# Altium project Sound_Sensor.PrjPcb (part 2 of 4)

## Sheet Connector_Sheet.SchDoc
size A4; DocumentNumber: 9; SheetNumber: 9; SheetTotal: 11
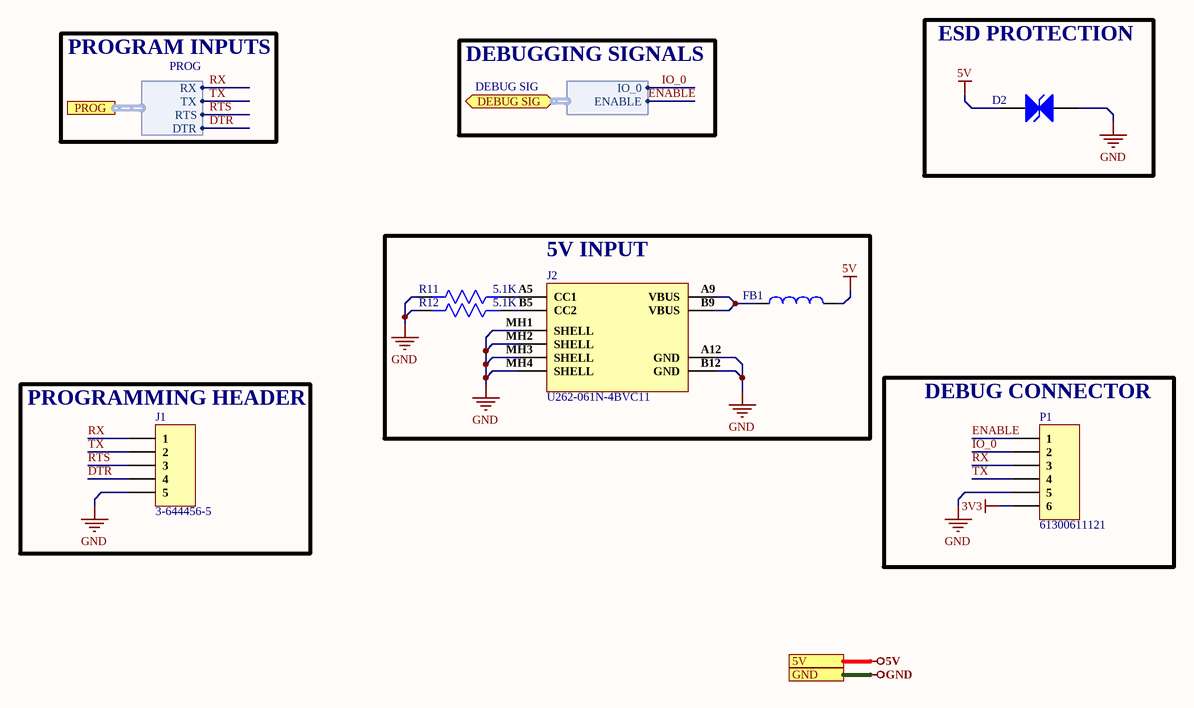
[diagram p4: Connector_Sheet.SchDoc]

### Parts
D2  TPD1E10B06DPYR  [X1SON - 0.45 mm max height]  (value not drawn)
FB1  BLM18SG121TN1D  [IND-0603 (1608 Metric)]  (value not drawn)
J1  3-644456-5  [HDR1X5]
J2  U262-061N-4BVC11  [U262-061N-4BVC11]
P1  61300611121  [HDR1X6]
R11  5.1K  [Res0603]
R12  5.1K  [Res0603]

### Blocks framed on the sheet
ESD PROTECTION: D2
5V INPUT: FB1 J2 R11 R12
PROGRAMMING HEADER: J1
DEBUG CONNECTOR: P1

### Ports
5V, DEBUG SIG (bidir, harness DEBUG SIG), GND, PROG (harness PROG)

### Harnesses
PROG: RX, TX, RTS, DTR
DEBUG SIG: IO_0, ENABLE

### Nets
3V3: P1.6
5V: D2.2 FB1.2 ; port 5V
GND: D2.1 J1.5 J2.A12(GND) J2.B12(GND) J2.MH1(SHELL) J2.MH2(SHELL) J2.MH3(SHELL) J2.MH4(SHELL) P1.5 R11.2 R12.2 ; port GND
DTR: J1.4 ; port PROG.DTR
ENABLE: P1.1 ; port DEBUG SIG.ENABLE  [project net DEBUG SIG.ENABLE]
IO_0: P1.2 ; port DEBUG SIG.IO_0  [project net DEBUG SIG.IO_0]
RTS: J1.3 ; port PROG.RTS
RX: J1.1 P1.3 ; port PROG.RX
TX: J1.2 P1.4 ; port PROG.TX
NetFB1_1: FB1.1 J2.A9(VBUS) J2.B9(VBUS)
NetJ2_A5: J2.A5(CC1) R11.1
NetJ2_B5: J2.B5(CC2) R12.1

### Notes on the sheet
- PROGRAM INPUTS
- DEBUGGING SIGNALS
- File:
- Title:
- Date:
- Page
- Num:
- Total:
- Drawn By: Huzaifa Ali

### Library data of the parts
D2 = TPD1E10B06DPYR: DIODE TVS SMD 5.5V 5A 90W; Manufacturer: Texas Instruments; Capacitance: 12pF; Direction: Bidirectional; Breakdown Voltage: 6V; Number of Channels: 1; Clamping Voltage: 14V; Power Line Protection: No; Leakage Current: 100nA; ESD Protection: Yes; Test Current: 1mA; Element Configuration: Single; Interface: GPIO; Diode Type: ZENER; Supplier 1: Mouser; Manufacturer Part Number: TPD1E10B06DPYR; RoHS: Yes; Category: TVS Diodes; Pricing 1: 1=0.39000, 10=0.29800, 50=0.29800, 100=0.18600, 500=0.12700, 1000=0.09800, 2500=0.08300, 10000=0.07500 (USD); Case/Package: SON; Number of Pins: 2; Contact Plating: Gold; Min Operating Temperature: -40°C; Max Operating Temperature: 125°C; Package Quantity: 1; Packaging: Tape and Reel; Number of Bidirectional Channels: 1; Reverse Standoff Voltage: 5.5V; Min Breakdown Voltage: 6V; Peak Pulse Power: 90W; Working Voltage: 5.5V; Max Reverse Leakage Current: 100nA; Peak Pulse Current: 5A; Resistor Type: Zener; Series: -; Length: 1.1mm; Width: 0.7mm; Height: 0.35mm; Radiation Hardening: No; REACH SVHC: No SVHC; Lead Free: Lead Free; RoHS Compliant: Yes; ComponentLink1URL: https://datasheet.ciiva.com/22691/1877100-22691786.pdf?src-supplier=Element14; ComponentLink1Description: https://datasheet.ciiva.com/22691/1877100-22691786.pdf?src-supplier=Element14; ComponentLink2URL: https://datasheet.ciiva.com/46384/1877100-46384054.pdf?src-supplier=Element14; ComponentLink2Description: https://datasheet.ciiva.com/46384/1877100-46384054.pdf?src-supplier=Element14; ComponentLink3URL: https://datasheet.ciiva.com/2961/tpd1e10b06-2961245.pdf?src-supplier=Digi-Key; ComponentLink3Description: https://datasheet.ciiva.com/2961/tpd1e10b06-2961245.pdf?src-supplier=Digi-Key; ComponentLink4URL: https://datasheet.ciiva.com/6574/tpd1e10b06-6574654.pdf?src-supplier=Digi-Key; ComponentLink4Description: https://datasheet.ciiva.com/6574/tpd1e10b06-6574654.pdf?src-supplier=Digi-Key; ComponentLink5URL: https://datasheet.ciiva.com/2961/tpd1e10b06-2961246.pdf?src-supplier=Digi-Key; ComponentLink5Description: https://datasheet.ciiva.com/2961/tpd1e10b06-2961246.pdf?src-supplier=Digi-Key; ComponentLink6URL: https://datasheet.ciiva.com/14195/tpd1e10b06-14195178.pdf?src-supplier=Avnet; ComponentLink6Description: https://datasheet.ciiva.com/14195/tpd1e10b06-14195178.pdf?src-supplier=Avnet; Supplier Part Number 1: 595-TPD1E10B06DPYR
FB1 = BLM18SG121TN1D: FERRITE BEAD 120 OHM 0603 1LN; Manufacturer: Murata; Material: Steel,Ferrite; Tolerance: 25%; Impedance: 120R; DC Resistance (DCR): 25mR; Max DC Current: 3A; Number of Lines: 1; Test Frequency: 100MHz; Shielding: Unshielded; Supplier 1: Arrow Electronics; Manufacturer Part Number: BLM18SG121TN1D; RoHS: Yes; Category: Ferrite Beads and Chips; Stock 1: 82612; Pricing 1: 1=0.12640, 10=0.08350, 25=0.07210, 100=0.05150, 250=0.04730, 500=0.04110, 1000=0.03420, 3000=0.03360, 6000=0.03320, 15000=0.03270, 30000=0.03200, 75000=0.03150 (USD); Case/Package: 0603; Number of Pins: 2; Core Material: Ferrite; Case Code (Metric): 1608; Case Code (Imperial): 0603; Min Operating Temperature: -55°C; Max Operating Temperature: 125°C; Package Quantity: 1; Max Current Rating: 3A; Packaging: Tape and Reel; Current Rating: 3A; Termination: SMD/SMT; Frequency: 100MHz; Number of Circuits: 1; Series: BLM18S; DC Resistance-Max: 25mR; Length: 1.6mm; Width: 0.8mm; Height: 0.8mm; Depth: 0.8mm; Reach SVHC Compliant: Yes; Lead Free: Lead Free; RoHS Compliant: Yes; ComponentLink1URL: https://datasheet.ciiva.com/1012/l0110s0100blm18s-1012624.pdf?src-supplier=Digi-Key; ComponentLink1Description: https://datasheet.ciiva.com/1012/l0110s0100blm18s-1012624.pdf?src-supplier=Digi-Key; ComponentLink2URL: https://datasheet.ciiva.com/11799/0900766b811b5866-11799181.pdf?src-supplier=RSComponents; ComponentLink2Description: https://datasheet.ciiva.com/11799/0900766b811b5866-11799181.pdf?src-supplier=RSComponents; ComponentLink3URL: https://datasheet.ciiva.com/18093/getdatasheetpartid-295885-18093249.pdf?src-supplier=Verical; ComponentLink3Description: https://datasheet.ciiva.com/18093/getdatasheetpartid-295885-18093249.pdf?src-supplier=Verical; ComponentLink4URL: https://datasheet.ciiva.com/41449/001171723-da-01-en-chip-drossel0603-120r-3000ma-1-6x0-8mm-41449353.pdf?src-supplier=Conrad; ComponentLink4Description: https://datasheet.ciiva.com/41449/001171723-da-01-en-chip-drossel0603-120r-3000ma-1-6x0-8mm-41449353.pdf?src-supplier=Conrad; ComponentLink5URL: https://datasheet.ciiva.com/41449/001172312-da-01-en-drossel-0603-120r-1-6x0-8mm-10000st-41449675.pdf?src-supplier=Conrad; ComponentLink5Description: https://datasheet.ciiva.com/41449/001172312-da-01-en-drossel-0603-120r-1-6x0-8mm-10000st-41449675.pdf?src-supplier=Conrad; ComponentLink6URL: https://datasheet.ciiva.com/8021/5151-8021511.pdf?src-supplier=Element14; ComponentLink6Description: https://datasheet.ciiva.com/8021/5151-8021511.pdf?src-supplier=Element14; ComponentLink7URL: https://datasheet.ciiva.com/8021/5151-8021512.pdf?src-supplier=Element14; ComponentLink7Description: https://datasheet.ciiva.com/8021/5151-8021512.pdf?src-supplier=Element14; ComponentLink8URL: https://datasheet.ciiva.com/14122/blm-series-eng-tds-14122906.pdf?src-supplier=Distrelec; ComponentLink8Description: https://datasheet.ciiva.com/14122/blm-series-eng-tds-14122906.pdf?src-supplier=Distrelec; ComponentLink9URL: https://datasheet.ciiva.com/1012/l0110s0100blm18s-1012623.pdf?src-supplier=Digi-Key; ComponentLink9Description: https://datasheet.ciiva.com/1012/l0110s0100blm18s-1012623.pdf?src-supplier=Digi-Key; ComponentLink10URL: https://datasheet.ciiva.com/1012/l0110s0100blm18s-1012625.pdf?src-supplier=Digi-Key; ComponentLink10Description: https://datasheet.ciiva.com/1012/l0110s0100blm18s-1012625.pdf?src-supplier=Digi-Key; ComponentLink11URL: https://datasheet.ciiva.com/16395/l0110s0100blm18s-16395498.pdf?src-supplier=Future+Electronics; ComponentLink11Description: https://datasheet.ciiva.com/16395/l0110s0100blm18s-16395498.pdf?src-supplier=Future+Electronics; Supplier Part Number 1: BLM18SG121TN1D; LCSC Part Number: C113030; Item Type: Ferrite Bead
J1 = 3-644456-5: 05P MTA100 HDR ASSY (NARROW); Manufacturer: TE Connectivity; Underplate Material: Nickel; Number of Positions: 5; Connector Type: Plug,Header,Pin; Mating Alignment: No (Without); PCB Mount Retention: Without; Max Voltage Rating (AC): 250V; Connector System: Wire-to-Board; Contact Current Rating: 5A; Contact Resistance: 6mR; Gender: Male; PCB Mounting Orientation: Vertical; Contact Style: Straight; Pitch: 2.54mm; Plating Thickness: 1.27um; PCB Thickness: 0.063inch; Tail Length: 0.11inch; Approvals: CSA; Supplier 1: Digi-Key; Manufacturer Part Number: 3-644456-5; RoHS: Yes; Category: Connectors; Stock 1: 30835; Pricing 1: 1=0.45000, 10=0.39200, 100=0.32330, 500=0.28114, 1000=0.23195, 5000=0.20383, 10000=0.18978 (USD); Mount: Through Hole; Color: Natural; Housing Material: Polyester; Housing Color: Natural; Contact Plating: Tin,Matte; Contact Material: Copper Alloy; Contact Shape: Square; Insulation Material: Thermoplastic; Insulation Color: Natural; Contact Finish - Mating: TIN; Min Operating Temperature: -67°C; Max Operating Temperature: 221°C; Number of Rows: 1; Packaging: Bag; Package Quantity: 500; Contact Gender: Male; Termination: Solder; Orientation: Straight; Number of Contacts: 5; Strain Relief: No (Without); Contact Retention: No (Without); Mating Retention: No (Without); PCB Mount Alignment: No (Without); Sealable: No (Without); Shrouded: No (Without); Voltage Rating: 250V; Voltage Rating (AC): 250V; Current Rating: 5A; Backwall/Post Interruptions: No (Without); Series: MTA-100; Contact Type: Male Pin; Length: 12.4mm; Height: 10.03mm; Contact Mating Length: 7.49mm; Depth: 2.33mm; Radiation Hardening: No; Flammability Rating: UL94 V-0; ELV: Compliant; Lead Free: Lead Free; REACH SVHC: Unknown; ComponentLink1URL: https://datasheet.ciiva.com/16307/3-644456-5-16307486.pdf?src-supplier=Future+Electronics; ComponentLink1Description: https://datasheet.ciiva.com/16307/3-644456-5-16307486.pdf?src-supplier=Future+Electronics; ComponentLink2URL: https://datasheet.ciiva.com/3118/eng-ds-82056-mta-0608-3118213.pdf?src-supplier=Avnet; ComponentLink2Description: https://datasheet.ciiva.com/3118/eng-ds-82056-mta-0608-3118213.pdf?src-supplier=Avnet; ComponentLink3URL: https://datasheet.ciiva.com/30250/8852eng-ds-82056-mta-0608-30250984.pdf?src-supplier=Onlinecomponents.com; ComponentLink3Description: https://datasheet.ciiva.com/30250/8852eng-ds-82056-mta-0608-30250984.pdf?src-supplier=Onlinecomponents.com; ComponentLink4URL: https://datasheet.ciiva.com/14641/70087179-14641766.pdf?src-supplier=Allied+Electronics; ComponentLink4Description: https://datasheet.ciiva.com/14641/70087179-14641766.pdf?src-supplier=Allied+Electronics; ComponentLink5URL: https://datasheet.ciiva.com/709/eng-cd-644456-d2-709724.pdf?src-supplier=Digi-Key; ComponentLink5Description: https://datasheet.ciiva.com/709/eng-cd-644456-d2-709724.pdf?src-supplier=Digi-Key; Supplier Part Number 1: A31115-ND
J2 = U262-061N-4BVC11: USB 3.1 1 Surface Mount 6 Female -25℃~+85℃ Type-C SMD USB Connectors ROHS; Manufacturer: XKB; Manufacturer Part Number: U262-061N-4BVC11; Footprint: Custom; ComponentLink1Description: LCSC; ComponentLink1URL: https://www.lcsc.com/product-detail/span-style-background-color-ff0-USB-span-Connectors_XKB-Connectivity-U262-061N-4BVC11_C2764612.html; LCSC Part Number: C2764612; Item Type: USB Connector
P1 = e-50004: CONN HEADER VERT 6POS 2.54MM; Manufacturer: Wurth Electronics; Current Rating: 3A; Voltage Rating: 250V; Number of Positions: 6; Gender: Male; Connector Type: Male Pin; Pitch: 0.1inch; Supplier 1: Digi-Key; Manufacturer Part Number: 61300611121; Stock 1: 14573; Pricing 1: 1=0.33, 10=0.279, 25=0.232, 50=0.194, 100=0.176, 1000=0.16 (USD); Mount: Through Hole; Contact Plating: Gold; Contact Material: Copper Alloy,Copper; Housing Material: PBT; Color: Black; Min Operating Temperature: -40°C; Max Operating Temperature: 125°C; Number of Rows: 1; Contact Gender: Male; Packaging: Bulk; Termination: Through Hole; Number of Contacts: 6; Contact Mating Length: 0.236inch; REACH SVHC: Unknown; Lead Free: Lead Free; ComponentLink1URL: http://www.farnell.com/cad/1737268.pdf?src-supplier=Element14; ComponentLink1Description: http://www.farnell.com/cad/1737268.pdf?src-supplier=Element14; ComponentLink2URL: https://katalog.we-online.de/em/datasheet/6130xx11121.pdf?src-supplier=Digi-Key; ComponentLink2Description: https://katalog.we-online.de/em/datasheet/6130xx11121.pdf?src-supplier=Digi-Key; ComponentLink3URL: http://www.mouser.com/ds/2/445/6130xx11121-538006.pdf?src-supplier=Mouser; ComponentLink3Description: http://www.mouser.com/ds/2/445/6130xx11121-538006.pdf?src-supplier=Mouser; Supplier Part Number 1: 732-5319-ND
R11 R12 = RC0603JR-075K1L: RES SMD 5.1K OHM 5% 1/10W 0603; Manufacturer: Yageo; Resistance: 5.1kR; Power Rating: 100mW; Voltage Rating: 50V; Temperature Coefficient: 100ppm/°C; Supplier 1: Digi-Key; Manufacturer Part Number: RC0603JR-075K1L; RoHS: Yes; Category: Chip SMD Resistors; Stock 1: 245818; Pricing 1: 1=0.10000, 10=0.02000, 100=0.00800, 1000=0.00360, 2500=0.00312 (USD); Case/Package: 0603; Number of Pins: 2; Case Code (Imperial): 0603; Case Code (Metric): 1608; Size Code: 0603; Min Operating Temperature: -55°C; Max Operating Temperature: 155°C; Tolerance: 5%; Packaging: Tape and Reel; Termination: SMD/SMT; Resistor Type: Thick Film; Voltage Rating (DC): 50V; Features: Moisture Resistant; Series: RC; Max Power Dissipation: 100mW; Number of Terminations: 2; Resistance Tolerance: 5%; Construction: Rectangular; Length: 1.6mm; Depth: 0.8mm; REACH SVHC: No SVHC; Military Standard: Not; Lead Free: Lead Free; RoHS Compliant: Yes; ComponentLink1URL: http://www.mouser.com/ds/2/447/RC0603-272842.pdf?src-supplier=Mouser; ComponentLink1Description: http://www.mouser.com/ds/2/447/RC0603-272842.pdf?src-supplier=Mouser; ComponentLink2URL: http://components.arrow.com/part/dataview/0323_00047491?src-supplier=Arrow+Europe; ComponentLink2Description: http://components.arrow.com/part/dataview/0323_00047491?src-supplier=Arrow+Europe; ComponentLink3URL: http://www.farnell.com/datasheets/2167052.pdf?src-supplier=Farnell; ComponentLink3Description: http://www.farnell.com/datasheets/2167052.pdf?src-supplier=Farnell; ComponentLink4URL: http://www.farnell.com/datasheets/2167052.pdf?src-supplier=Element14; ComponentLink4Description: http://www.farnell.com/datasheets/2167052.pdf?src-supplier=Element14; ComponentLink5URL: http://www.farnell.com/datasheets/2167052.pdf?src-supplier=Newark; ComponentLink5Description: http://www.farnell.com/datasheets/2167052.pdf?src-supplier=Newark; ComponentLink6URL: http://www.farnell.com/datasheets/1868787.pdf?src-supplier=Newark; ComponentLink6Description: http://www.farnell.com/datasheets/1868787.pdf?src-supplier=Newark; ComponentLink7URL: http://www.yageo.com/documents/recent/PYu-RC_Group_51_RoHS_L_10.pdf?src-supplier=Digi-Key; ComponentLink7Description: http://www.yageo.com/documents/recent/PYu-RC_Group_51_RoHS_L_10.pdf?src-supplier=Digi-Key; ComponentLink8URL: http://www.yageo.com/documents/recent/PYu-RC0603_51_RoHS_L_7.pdf?src-supplier=Future+Electronics; ComponentLink8Description: http://www.yageo.com/documents/recent/PYu-RC0603_51_RoHS_L_7.pdf?src-supplier=Future+Electronics; Supplier Part Number 1: 311-5.1KGRCT-ND

## Sheet ADC_2_Section.SchDoc
size A4; DocumentNumber: 7; SheetNumber: 7; SheetTotal: 11
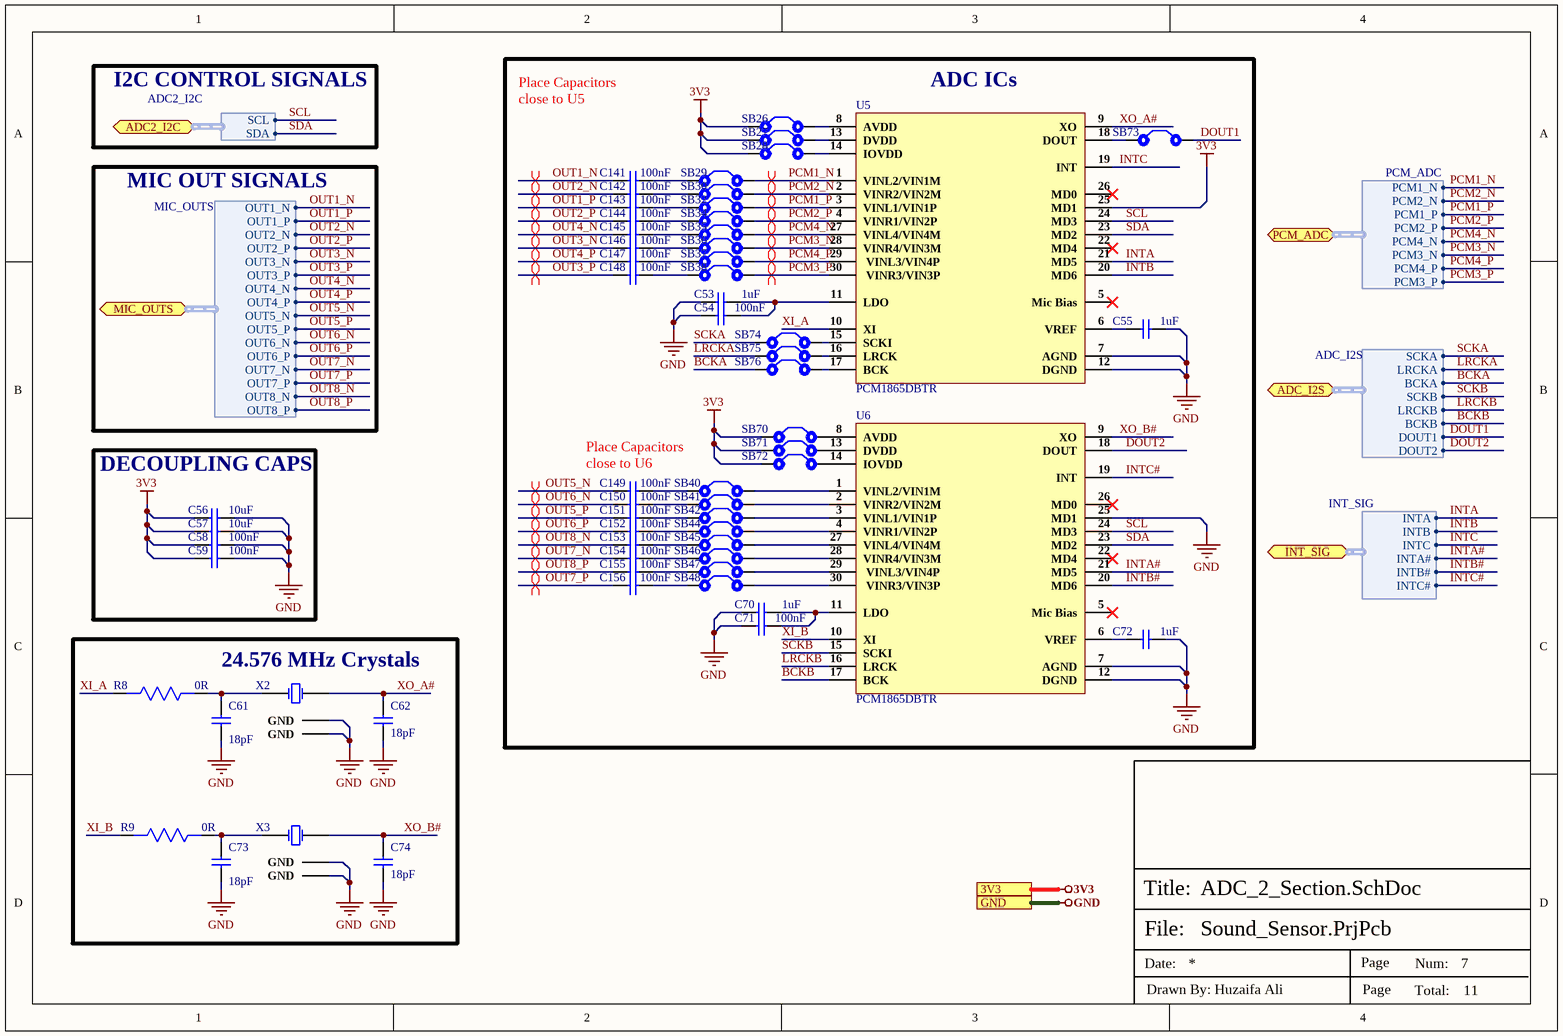
[diagram p5: ADC_2_Section.SchDoc]

### Parts
C53  1uF  [Cap-0402]
C54  100nF  [Cap-0603]
C55  1uF  [Cap-0402]
C56  10uF  [Cap-0603]
C57  10uF  [Cap-0603]
C58  100nF  [Cap-0603]
C59  100nF  [Cap-0603]
C61  18pF  [Cap 0603]
C62  18pF  [Cap 0603]
C70  1uF  [Cap-0402]
C71  100nF  [Cap-0603]
C72  1uF  [Cap-0402]
C73  18pF  [Cap 0603]
C74  18pF  [Cap 0603]
C141  100nF  [Cap-0402]
C142  100nF  [Cap-0402]
C143  100nF  [Cap-0402]
C144  100nF  [Cap-0402]
C145  100nF  [Cap-0402]
C146  100nF  [Cap-0402]
C147  100nF  [Cap-0402]
C148  100nF  [Cap-0402]
C149  100nF  [Cap-0402]
C150  100nF  [Cap-0402]
C151  100nF  [Cap-0402]
C152  100nF  [Cap-0402]
C153  100nF  [Cap-0402]
C154  100nF  [Cap-0402]
C155  100nF  [Cap-0402]
C156  100nF  [Cap-0402]
R8  0R  [Res0603]
R9  0R  [Res0603]
SB26  Solder Bridge  [Solder Bridge]  (value not drawn)
SB27  Solder Bridge  [Solder Bridge]  (value not drawn)
SB28  Solder Bridge  [Solder Bridge]  (value not drawn)
SB29  Solder Bridge  [Solder Bridge]  (value not drawn)
SB30  Solder Bridge  [Solder Bridge]  (value not drawn)
SB32  Solder Bridge  [Solder Bridge]  (value not drawn)
SB34  Solder Bridge  [Solder Bridge]  (value not drawn)
SB35  Solder Bridge  [Solder Bridge]  (value not drawn)
SB36  Solder Bridge  [Solder Bridge]  (value not drawn)
SB37  Solder Bridge  [Solder Bridge]  (value not drawn)
SB38  Solder Bridge  [Solder Bridge]  (value not drawn)
SB40  Solder Bridge  [Solder Bridge]  (value not drawn)
SB41  Solder Bridge  [Solder Bridge]  (value not drawn)
SB42  Solder Bridge  [Solder Bridge]  (value not drawn)
SB44  Solder Bridge  [Solder Bridge]  (value not drawn)
SB45  Solder Bridge  [Solder Bridge]  (value not drawn)
SB46  Solder Bridge  [Solder Bridge]  (value not drawn)
SB47  Solder Bridge  [Solder Bridge]  (value not drawn)
SB48  Solder Bridge  [Solder Bridge]  (value not drawn)
SB70  Solder Bridge  [Solder Bridge]  (value not drawn)
SB71  Solder Bridge  [Solder Bridge]  (value not drawn)
SB72  Solder Bridge  [Solder Bridge]  (value not drawn)
SB73  Solder Bridge  [Solder Bridge]  (value not drawn)
SB74  Solder Bridge  [Solder Bridge]  (value not drawn)
SB75  Solder Bridge  [Solder Bridge]  (value not drawn)
SB76  Solder Bridge  [Solder Bridge]  (value not drawn)
U5  PCM1865DBTR  [PCM1865DBTR]
U6  PCM1865DBTR  [PCM1865DBTR]
X2  S3224576121060  [S3224576121060]  (value not drawn)
X3  S3224576121060  [S3224576121060]  (value not drawn)

### Blocks framed on the sheet
ADC ICs: C53-C55 C70-C72 C141-C156 SB26-SB30 SB32 SB34-SB38 SB40-SB42 SB44-SB48 SB70-SB76 U5 U6
DECOUPLING CAPS: C56-C59
24.576 MHz Crystals: C61 C62 C73 C74 R8 R9 X2 X3

### Ports
3V3, ADC2_I2C (bidir, harness ADC2_I2C), ADC_I2S (bidir, harness ADC_I2S), GND, INT_SIG (bidir, harness INT_SIG), MIC_OUTS (bidir, harness MIC_OUTS), PCM_ADC (bidir, harness PCM_ADC)

### Harnesses
MIC_OUTS: OUT1_N, OUT1_P, OUT2_N, OUT2_P, OUT3_N, OUT3_P, OUT4_N, OUT4_P, OUT5_N, OUT5_P, OUT6_N, OUT6_P, OUT7_N, OUT7_P, OUT8_N, OUT8_P
ADC_I2S: SCKA, LRCKA, BCKA, SCKB, LRCKB, BCKB, DOUT1, DOUT2
INT_SIG: INTA, INTB, INTC, INTA#, INTB#, INTC#
ADC2_I2C: SCL, SDA
PCM_ADC: PCM1_N, PCM2_N, PCM1_P, PCM2_P, PCM4_N, PCM3_N, PCM4_P, PCM3_P

### Nets
3V3: C56.1 C57.1 C58.1 C59.1 SB26.1 SB27.1 SB28.1 SB70.1 SB71.1 SB72.1 U5.25(MD1) ; port 3V3
GND: C53.1 C54.1 C55.2 C56.2 C57.2 C58.2 C59.2 C61.1 C62.1 C70.1 C71.1 C72.2 C73.1 C74.1 U5.7(AGND) U5.12(DGND) U6.7(AGND) U6.12(DGND) U6.25(MD1) X2.2(GND) X2.4(GND) X3.2(GND) X3.4(GND) ; port GND
BCKA: SB76.1 ; port ADC_I2S.BCKA  [project net ADC_I2S.BCKA]
BCKB: U6.17(BCK) ; port ADC_I2S.BCKB  [project net ADC_I2S.BCKB]
DOUT1: SB73.2 ; port ADC_I2S.DOUT1  [project net ADC_I2S.DOUT1]
DOUT2: U6.18(DOUT) ; port ADC_I2S.DOUT2  [project net ADC_I2S.DOUT2]
INTA: U5.21(MD5) ; port INT_SIG.INTA
INTA#: U6.21(MD5) ; port INT_SIG.INTA#
INTB: U5.20(MD6) ; port INT_SIG.INTB
INTB#: U6.20(MD6) ; port INT_SIG.INTB#
INTC: U5.19(INT) ; port INT_SIG.INTC
INTC#: U6.19(INT) ; port INT_SIG.INTC#
LRCKA: SB75.1 ; port ADC_I2S.LRCKA  [project net ADC_I2S.LRCKA]
LRCKB: U6.16(LRCK) ; port ADC_I2S.LRCKB  [project net ADC_I2S.LRCKB]
OUT1_N: C141.1 ; port MIC_OUTS.OUT1_N  [project net MIC_OUTS.OUT1_N]
OUT1_P: C143.1 ; port MIC_OUTS.OUT1_P  [project net MIC_OUTS.OUT1_P]
OUT2_N: C142.1 ; port MIC_OUTS.OUT2_N  [project net MIC_OUTS.OUT2_N]
OUT2_P: C144.1 ; port MIC_OUTS.OUT2_P  [project net MIC_OUTS.OUT2_P]
OUT3_N: C146.1 ; port MIC_OUTS.OUT3_N  [project net MIC_OUTS.OUT3_N]
OUT3_P: C148.1 ; port MIC_OUTS.OUT3_P  [project net MIC_OUTS.OUT3_P]
OUT4_N: C145.1 ; port MIC_OUTS.OUT4_N  [project net MIC_OUTS.OUT4_N]
OUT4_P: C147.1 ; port MIC_OUTS.OUT4_P  [project net MIC_OUTS.OUT4_P]
OUT5_N: C149.1 ; port MIC_OUTS.OUT5_N  [project net MIC_OUTS.OUT5_N]
OUT5_P: C151.1 ; port MIC_OUTS.OUT5_P  [project net MIC_OUTS.OUT5_P]
OUT6_N: C150.1 ; port MIC_OUTS.OUT6_N  [project net MIC_OUTS.OUT6_N]
OUT6_P: C152.1 ; port MIC_OUTS.OUT6_P  [project net MIC_OUTS.OUT6_P]
OUT7_N: C154.1 ; port MIC_OUTS.OUT7_N  [project net MIC_OUTS.OUT7_N]
OUT7_P: C156.1 ; port MIC_OUTS.OUT7_P  [project net MIC_OUTS.OUT7_P]
OUT8_N: C153.1 ; port MIC_OUTS.OUT8_N  [project net MIC_OUTS.OUT8_N]
OUT8_P: C155.1 ; port MIC_OUTS.OUT8_P  [project net MIC_OUTS.OUT8_P]
PCM1_N: SB29.2 U5.1(VINL2/VIN1M) ; port PCM_ADC.PCM1_N
PCM1_P: SB32.2 U5.3(VINL1/VIN1P) ; port PCM_ADC.PCM1_P
PCM2_N: SB30.2 U5.2(VINR2/VIN2M) ; port PCM_ADC.PCM2_N
PCM2_P: SB34.2 U5.4(VINR1/VIN2P) ; port PCM_ADC.PCM2_P
PCM3_N: SB36.2 U5.28(VINR4/VIN3M) ; port PCM_ADC.PCM3_N
PCM3_P: SB38.2 U5.30(VINR3/VIN3P) ; port PCM_ADC.PCM3_P
PCM4_N: SB35.2 U5.27(VINL4/VIN4M) ; port PCM_ADC.PCM4_N
PCM4_P: SB37.2 U5.29(VINL3/VIN4P) ; port PCM_ADC.PCM4_P
SCKA: SB74.1 ; port ADC_I2S.SCKA  [project net ADC_I2S.SCKA]
SCKB: U6.15(SCKI) ; port ADC_I2S.SCKB  [project net ADC_I2S.SCKB]
SCL: U5.24(MD3) U6.24(MD3) ; port ADC2_I2C.SCL
SDA: U5.23(MD2) U6.23(MD2) ; port ADC2_I2C.SDA
XI_A: R8.2 U5.10(XI)
XI_B: R9.2 U6.10(XI)
XO_A#: C62.2 U5.9(XO) X2.3(OSC2)
XO_B#: C74.2 U6.9(XO) X3.3(OSC2)
NetC53_2: C53.2 C54.2 U5.11(LDO)
NetC55_1: C55.1 U5.6(VREF)
NetC61_2: C61.2 R8.1 X2.1(OSC1)
NetC70_2: C70.2 C71.2 U6.11(LDO)
NetC72_1: C72.1 U6.6(VREF)
NetC73_2: C73.2 R9.1 X3.1(OSC1)
NetC141_2: C141.2 SB29.1
NetC142_2: C142.2 SB30.1
NetC143_2: C143.2 SB32.1
NetC144_2: C144.2 SB34.1
NetC145_2: C145.2 SB35.1
NetC146_2: C146.2 SB36.1
NetC147_2: C147.2 SB37.1
NetC148_2: C148.2 SB38.1
NetC149_2: C149.2 SB40.1
NetC150_2: C150.2 SB41.1
NetC151_2: C151.2 SB42.1
NetC152_2: C152.2 SB44.1
NetC153_2: C153.2 SB45.1
NetC154_2: C154.2 SB46.1
NetC155_2: C155.2 SB47.1
NetC156_2: C156.2 SB48.1
NetSB26_2: SB26.2 U5.8(AVDD)
NetSB27_2: SB27.2 U5.13(DVDD)
NetSB28_2: SB28.2 U5.14(IOVDD)
NetSB40_2: SB40.2 U6.1(VINL2/VIN1M)
NetSB41_2: SB41.2 U6.2(VINR2/VIN2M)
NetSB42_2: SB42.2 U6.3(VINL1/VIN1P)
NetSB44_2: SB44.2 U6.4(VINR1/VIN2P)
NetSB45_2: SB45.2 U6.27(VINL4/VIN4M)
NetSB46_2: SB46.2 U6.28(VINR4/VIN3M)
NetSB47_2: SB47.2 U6.29(VINL3/VIN4P)
NetSB48_2: SB48.2 U6.30(VINR3/VIN3P)
NetSB70_2: SB70.2 U6.8(AVDD)
NetSB71_2: SB71.2 U6.13(DVDD)
NetSB72_2: SB72.2 U6.14(IOVDD)
NetSB73_1: SB73.1 U5.18(DOUT)
NetSB74_2: SB74.2 U5.15(SCKI)
NetSB75_2: SB75.2 U5.16(LRCK)
NetSB76_2: SB76.2 U5.17(BCK)

Not connected (* = marked no-connect by the designer): U5 5(Mic_Bias)* 22(MD4)* 26(MD0)*; U6 5(Mic_Bias)* 22(MD4)* 26(MD0)*

### Layout directives
differential pair; differential pair class OUT1_Lines; net class OUT1: MIC_OUTS.OUT1_N, MIC_OUTS.OUT1_P, PCM1_N, PCM1_P, PCM2_N, PCM2_P, PCM3_N, PCM3_P, PCM4_N, PCM4_P
differential pair; net class OUT2; differential pair class OUT2_Lines: MIC_OUTS.OUT2_N, MIC_OUTS.OUT2_P
differential pair; net class OUT4; differential pair class OUT4_Lines: MIC_OUTS.OUT4_N, MIC_OUTS.OUT4_P
differential pair; net class OUT3; differential pair class OUT3_Lines: MIC_OUTS.OUT3_N, MIC_OUTS.OUT3_P
differential pair; net class OUT5; differential pair class OUT5_Lines: MIC_OUTS.OUT5_N, MIC_OUTS.OUT5_P
differential pair; net class OUT6; differential pair class OUT6_Lines: MIC_OUTS.OUT6_N, MIC_OUTS.OUT6_P
differential pair; net class OUT8; differential pair class OUT8_Lines: MIC_OUTS.OUT8_N, MIC_OUTS.OUT8_P
differential pair; net class OUT7; differential pair class OUT7_Lines: MIC_OUTS.OUT7_N, MIC_OUTS.OUT7_P

### Notes on the sheet
- I2C CONTROL SIGNALS
- Place Capacitors close to U5
- MIC OUT SIGNALS
- Place Capacitors close to U6
- File:
- Title:
- Date:
- Page
- Num:
- Total:
- Drawn By: Huzaifa Ali

### Library data of the parts
C53 C55 C70 C72 = CC0402KRX5R8BB105: CAP CER 1UF 25V X5R 0402; Manufacturer: Yageo; Tolerance: 10%; Supplier 1: Mouser; Manufacturer Part Number: CC0402KRX5R8BB105; RoHS: Yes; Category: Ceramic Capacitors; Stock 1: 91975; Pricing 1: 1=0.30000, 10=0.20400, 50=0.20400, 100=0.11600, 1000=0.07200, 10000=0.05900 (USD); Mount: Surface Mount; Case/Package: 0402; Case Code (Metric): 1005; Case Code (Imperial): 0402; Weight: 2.3E-05oz; Min Operating Temperature: -55°C; Max Operating Temperature: 85°C; Packaging: Tape and Reel; Capacitance: 1uF; Voltage Rating: 25V; Dielectric: X5R; Termination: SMD/SMT; Voltage Rating (DC): 25V; Package Quantity: 10000; Length: 0.039inch; Width: 0.02inch; Thickness: 0.022inch; Lead Free: Lead Free; Halogen Free: Halogen Free; RoHS Compliant: Yes; ComponentLink1URL: http://www.mouser.com/ds/2/447/Yageo_UPY-GP_NP0_16V-to-50V_9-358835.pdf?src-supplier=Mouser; ComponentLink1Description: http://www.mouser.com/ds/2/447/Yageo_UPY-GP_NP0_16V-to-50V_9-358835.pdf?src-supplier=Mouser; ComponentLink2URL: http://www.yageo.com/documents/recent/UPY-GPHC_X5R_4V-to-50V_25.pdf?src-supplier=Digi-Key; ComponentLink2Description: http://www.yageo.com/documents/recent/UPY-GPHC_X5R_4V-to-50V_25.pdf?src-supplier=Digi-Key; ComponentLink3URL: https://4donline.ihs.com/images/VipMasterIC/IC/YAGO/YAGO-S-A0006851646/YAGO-S-A0006851646-1.pdf?hkey=6D3A4C79FDBF58556ACFDE234799DDF0&src-supplier=Newark; ComponentLink3Description: https://4donline.ihs.com/images/VipMasterIC/IC/YAGO/YAGO-S-A0006851646/YAGO-S-A0006851646-1.pdf?hkey=6D3A4C79FDBF58556ACFDE234799DDF0&src-supplier=Newark; Supplier Part Number 1: 603-CC402KRX5R8BB105; LCSC Part Number: C326568
C54 C58 C59 C71 = CC0603KRX5R9BB104: CAP CER 0.1UF 50V X5R 0603; Manufacturer: Yageo; Tolerance: 10%; Item Type: Capacitor; Supplier 1: Digi-Key; Manufacturer Part Number: CC0603KRX5R9BB104; RoHS: Yes; Category: Ceramic Capacitors; Stock 1: 152253; Pricing 1: 1=0.10000, 10=0.05200, 50=0.02820, 100=0.02310, 500=0.01648, 1000=0.01294 (USD); Mount: Surface Mount; Case/Package: 0603; Case Code (Imperial): 0603; Case Code (Metric): 1608; Weight: 7.1E-05oz; Min Operating Temperature: -55°C; Max Operating Temperature: 85°C; Capacitance: 100nF; Packaging: Tape and Reel; Voltage Rating: 50V; Dielectric: X5R; Termination: SMD/SMT; Voltage Rating (DC): 50V; Package Quantity: 4000; Length: 0.063inch; Width: 0.031inch; Thickness: 0.035inch; Lead Free: Lead Free; Halogen Free: Halogen Free; ComponentLink1URL: http://www.mouser.com/ds/2/447/Yageo_UPY-GP_NP0_16V-to-50V_9-358835.pdf?src-supplier=Mouser; ComponentLink1Description: http://www.mouser.com/ds/2/447/Yageo_UPY-GP_NP0_16V-to-50V_9-358835.pdf?src-supplier=Mouser; ComponentLink2URL: https://www.yageo.com/upload/media/product/productsearch/datasheet/mlcc/UPY-GPHC_X5R_4V-to-50V_26.pdf?src-supplier=Digi-Key; ComponentLink2Description: https://www.yageo.com/upload/media/product/productsearch/datasheet/mlcc/UPY-GPHC_X5R_4V-to-50V_26.pdf?src-supplier=Digi-Key; ComponentLink3URL: http://www.yageo.com/exep/pages/download/literatures/ProductSelectionGuide%202014_Final_2.pdf?src-supplier=Digi-Key; ComponentLink3Description: http://www.yageo.com/exep/pages/download/literatures/ProductSelectionGuide%202014_Final_2.pdf?src-supplier=Digi-Key; Supplier Part Number 1: 311-4046-1-ND; LCSC Part Number: C110022
C56 C57 = C1608X5R1E106M080AC: CAP CER 10UF 25V X5R 0603; Manufacturer: TDK; Dielectric Material: Ceramic; Tolerance: 20%; Supplier 1: Digi-Key; Manufacturer Part Number: C1608X5R1E106M080AC; Stock 1: 61681; Pricing 1: 1=0.96, 10=0.704, 100=0.483, 500=0.38238, 1000=0.322 (USD); Mount: Surface Mount; Case/Package: 0603; Weight: 7.1E-05oz; Case Code (Imperial): 0603; Case Code (Metric): 1608; Min Operating Temperature: -55°C; Max Operating Temperature: 85°C; Capacitance: 10uF; Packaging: Tape and Reel; Voltage Rating: 25V; Voltage Rating (DC): 25V; Termination: SMD/SMT; Package Quantity: 1; Dielectric: X5R; Composition: Ceramic; Length: 1.6mm; Height: 0.8mm; Width: 0.8mm; Thickness: 0.039inch; Depth: 0.8mm; Lead Free: Lead Free; REACH SVHC: No SVHC; Supplier Part Number 1: 445-9015-1-ND; LCSC Part Number: C2168289
C61 C62 C73 C74 = CC0603JRNPO9BN180: CAP SMD 18pF ±5.0% 50V NPO 0603; Manufacturer: Yageo; Tolerance: 5%; Dielectric: C0G; Temperature Coefficient: 30ppm/°C; Insulation Resistance: 100GR; Supplier 1: Newark; Manufacturer Part Number: CC0603JRNPO9BN180; RoHS: Yes; Category: Ceramic Capacitors; Stock 1: 77880; Pricing 1: 1=0.09900, 25=0.08000, 50=0.06900, 100=0.04700, 250=0.03600, 500=0.02800, 1000=0.02300, 2500=0.01900 (USD); Mount: Surface Mount; Case/Package: 0603; Number of Pins: 2; Case Code (Metric): 1608; Case Code (Imperial): 0603; Min Operating Temperature: -55°C; Max Operating Temperature: 125°C; Capacitance: 18pF; Packaging: Tape and Reel; Voltage Rating: 50V; Voltage Rating (DC): 50V; Package Quantity: 1; Termination: SMD/SMT; Resistor Type: Ceramic; Series: CC; Length: 1.6mm; Width: 0.031inch; Height: 0.8mm; Thickness: 0.035inch; Depth: 0.8mm; Radiation Hardening: No; REACH SVHC: No SVHC; Lead Free: Lead Free; RoHS Compliant: Yes; ComponentLink1URL: https://datasheet.ciiva.com/144/mlccorderingcode-144638.pdf?src-supplier=Digi-Key; ComponentLink1Description: https://datasheet.ciiva.com/144/mlccorderingcode-144638.pdf?src-supplier=Digi-Key; ComponentLink2URL: https://datasheet.ciiva.com/144/mlccorderingcode-144637.pdf?src-supplier=Digi-Key; ComponentLink2Description: https://datasheet.ciiva.com/144/mlccorderingcode-144637.pdf?src-supplier=Digi-Key; ComponentLink3URL: https://datasheet.ciiva.com/144/mlccorderingcode-144639.pdf?src-supplier=Digi-Key; ComponentLink3Description: https://datasheet.ciiva.com/144/mlccorderingcode-144639.pdf?src-supplier=Digi-Key; ComponentLink4URL: https://datasheet.ciiva.com/28450/1443161-28450477.pdf?src-supplier=Element14; ComponentLink4Description: https://datasheet.ciiva.com/28450/1443161-28450477.pdf?src-supplier=Element14; ComponentLink5URL: https://datasheet.ciiva.com/46430/1835847-46430152.pdf?src-supplier=Element14; ComponentLink5Description: https://datasheet.ciiva.com/46430/1835847-46430152.pdf?src-supplier=Element14; ComponentLink6URL: https://datasheet.ciiva.com/5425/upy-gp-np0-16v-to-50v-8-5425439.pdf?src-supplier=Mouser; ComponentLink6Description: https://datasheet.ciiva.com/5425/upy-gp-np0-16v-to-50v-8-5425439.pdf?src-supplier=Mouser; ComponentLink7URL: https://datasheet.ciiva.com/8033/1734582-8033733.pdf?src-supplier=Element14; ComponentLink7Description: https://datasheet.ciiva.com/8033/1734582-8033733.pdf?src-supplier=Element14; ComponentLink8URL: https://datasheet.ciiva.com/11587/upy-gp-np0-16v-to-50v-8-11587323.pdf?src-supplier=Avnet; ComponentLink8Description: https://datasheet.ciiva.com/11587/upy-gp-np0-16v-to-50v-8-11587323.pdf?src-supplier=Avnet; Supplier Part Number 1: 68R4719
C141-C156 = CC0402KRX5R7BB104: CAP CER 0.1UF 16V X5R 0402; Manufacturer: Yageo; Tolerance: 10%; Supplier 1: Mouser; Manufacturer Part Number: CC0402KRX5R7BB104; RoHS: Yes; Category: Ceramic Capacitors; Stock 1: 936792; Pricing 1: 1=0.10000, 10=0.02300, 50=0.02300, 100=0.01100, 1000=0.00600, 10000=0.00400 (USD); Mount: Surface Mount; Case/Package: 0402; Number of Pins: 2; Case Code (Metric): 1005; Case Code (Imperial): 0402; Min Operating Temperature: -55°C; Max Operating Temperature: 85°C; Capacitance: 100nF; Dielectric: X5R; Packaging: Tape and Reel; Voltage Rating: 16V; Package Quantity: 1; Voltage Rating (DC): 16V; Termination: SMD/SMT; Resistor Type: Ceramic; Series: CC; Construction: Flat; Length: 1mm; Width: 0.02inch; Height: 0.5mm; Thickness: 0.022inch; Depth: 0.5mm; Radiation Hardening: No; REACH SVHC: Unknown; Lead Free: Lead Free; Halogen Free: Halogen Free; RoHS Compliant: Yes; ComponentLink1URL: https://datasheet.ciiva.com/155/mlccorderingcode-155879.pdf?src-supplier=Digi-Key; ComponentLink1Description: https://datasheet.ciiva.com/155/mlccorderingcode-155879.pdf?src-supplier=Digi-Key; ComponentLink2URL: https://datasheet.ciiva.com/155/mlccorderingcode-155878.pdf?src-supplier=Digi-Key; ComponentLink2Description: https://datasheet.ciiva.com/155/mlccorderingcode-155878.pdf?src-supplier=Digi-Key; ComponentLink3URL: https://datasheet.ciiva.com/155/mlccorderingcode-155880.pdf?src-supplier=Digi-Key; ComponentLink3Description: https://datasheet.ciiva.com/155/mlccorderingcode-155880.pdf?src-supplier=Digi-Key; ComponentLink4URL: https://datasheet.ciiva.com/11464/upy-gphc-x5r-4v-to-50v-12-11464869.pdf?src-supplier=Avnet; ComponentLink4Description: https://datasheet.ciiva.com/11464/upy-gphc-x5r-4v-to-50v-12-11464869.pdf?src-supplier=Avnet; Supplier Part Number 1: 603-CC402KRX5R7BB104; LCSC Part Number: C106204
R8 R9 = RC0603FR-070RL: RES SMD 0R, 1%, 0.1W, 0603; Manufacturer: Yageo; Resistance: 0mR; Power Rating: 100mW; Voltage Rating (DC): 50V; Temperature Coefficient: 200ppm/°C; Current Rating: 1A; Working Voltage: 75V; Supplier 1: Arrow Electronics; Manufacturer Part Number: RC0603FR-070RL; RoHS: Yes; Category: Chip SMD Resistors; Stock 1: 1270000; Pricing 1: 5000=0.00320, 5000=0.00490, 50000=0.00450, 500000=0.00250, 2500000=0.00150 (USD); Case/Package: 0603; Number of Pins: 2; Contact Plating: Tin,Matte; Case Code (Metric): 1608; Case Code (Imperial): 0603; Min Operating Temperature: -55°C; Max Operating Temperature: 155°C; Resistor Type: Thick Film; Packaging: Tape and Reel; Tolerance: 1%; Package Quantity: 5000; Voltage Rating: 50V; Number of Terminations: 2; Termination: SMD/SMT; Max Power Dissipation: 100mW; Features: Moisture Resistant; Length: 1.6mm; Width: 0.031inch; Height: 0.45mm; Depth: 0.8mm; Radiation Hardening: No; REACH SVHC: No SVHC; Lead Free: Lead Free; Military Standard: Not; ComponentLink1URL: https://datasheet.ciiva.com/11808/0900766b80f96399-11808172.pdf?src-supplier=RSComponents; ComponentLink1Description: https://datasheet.ciiva.com/11808/0900766b80f96399-11808172.pdf?src-supplier=RSComponents; ComponentLink2URL: https://datasheet.ciiva.com/5558/rc0603-272842-5558341.pdf?src-supplier=Mouser; ComponentLink2Description: https://datasheet.ciiva.com/5558/rc0603-272842-5558341.pdf?src-supplier=Mouser; ComponentLink3URL: https://datasheet.ciiva.com/46382/443971-46382072.pdf?src-supplier=Element14; ComponentLink3Description: https://datasheet.ciiva.com/46382/443971-46382072.pdf?src-supplier=Element14; ComponentLink4URL: https://datasheet.ciiva.com/29721/pyu-r-int-thick-7-29721178.pdf?src-supplier=Digi-Key; ComponentLink4Description: https://datasheet.ciiva.com/29721/pyu-r-int-thick-7-29721178.pdf?src-supplier=Digi-Key; ComponentLink5URL: https://datasheet.ciiva.com/5684/443971-5684699.pdf?src-supplier=Farnell; ComponentLink5Description: https://datasheet.ciiva.com/5684/443971-5684699.pdf?src-supplier=Farnell; ComponentLink6URL: https://datasheet.ciiva.com/7983/443971-7983627.pdf?src-supplier=Element14; ComponentLink6Description: https://datasheet.ciiva.com/7983/443971-7983627.pdf?src-supplier=Element14; ComponentLink7URL: https://datasheet.ciiva.com/29721/pyu-rc0603-51-rohs-l-4-29721179.pdf?src-supplier=Digi-Key; ComponentLink7Description: https://datasheet.ciiva.com/29721/pyu-rc0603-51-rohs-l-4-29721179.pdf?src-supplier=Digi-Key; ComponentLink8URL: https://datasheet.ciiva.com/22643/1868787-22643388.pdf?src-supplier=Element14; ComponentLink8Description: https://datasheet.ciiva.com/22643/1868787-22643388.pdf?src-supplier=Element14; Supplier Part Number 1: RC0603FR-070RL
SB26-SB30 SB32 SB34-SB38 SB40-SB42 SB44-SB48 SB70-SB76 = Solder Bridge: Solder Bridge ON
U5 U6 = PCM1865DBTR: IC ADC/AUDIO 24BIT 192K 30TSSOP; Manufacturer: Texas Instruments; Interface: I2C,SPI,Serial; Operating Supply Voltage: 3.3V; Sampling Rate: 192KS/s; Resolution: 24b; Operating Supply Current: 31mA; Supply Type: Single; Number of A/D Converters: 4; Power Consumption: 145mW; Max Supply Voltage: 3.6V; Min Supply Voltage: 3V; Number of Analog Inputs: 8; Number of DAC Channels: 0; Supplier 1: Mouser; Manufacturer Part Number: PCM1865DBTR; RoHS: Yes; Category: Amplifiers - Audio; Pricing 1: 1=10.72000, 10=9.69000, 25=9.23000, 50=9.23000, 100=8.02000, 250=7.66000, 500=6.98000, 1000=6.54000, 10000=6.54000 (USD); Mount: Surface Mount; Case/Package: TSSOP; Number of Pins: 30; Weight: 0.003439oz; Contact Plating: Gold; Min Operating Temperature: -40°C; Max Operating Temperature: 125°C; Package Quantity: 2000; Packaging: Tape and Reel; Number of ADC Channels: 4; Lead Free: Lead Free; RoHS Compliant: Yes; ComponentLink1URL: https://datasheet.ciiva.com/48474/pcm1861-48474798.pdf?src-supplier=Avnet; ComponentLink1Description: https://datasheet.ciiva.com/48474/pcm1861-48474798.pdf?src-supplier=Avnet; ComponentLink2URL: https://datasheet.ciiva.com/29699/pcm1861-29699238.pdf?src-supplier=Digi-Key; ComponentLink2Description: https://datasheet.ciiva.com/29699/pcm1861-29699238.pdf?src-supplier=Digi-Key; Supplier Part Number 1: 595-PCM1865DBTR
X2 X3 = S3224576121060: 24.576MHz SMD Crystal Resonator 12pF 60Ω ±10ppm -40℃~+85℃ SMD3225-4P Crystals ROHS; Manufacturer: JGHC; Manufacturer Part Number: S3224576121060; Footprint: Custom; ComponentLink1Description: LCSC; ComponentLink1URL: https://lcsc.com/product-detail/Crystals_JGHC-S3224576121060_C390772.html; Value: 24.576MHz

## Sheet ADC_3_Section.SchDoc
size A4; DocumentNumber: 8; SheetNumber: 8; SheetTotal: 11
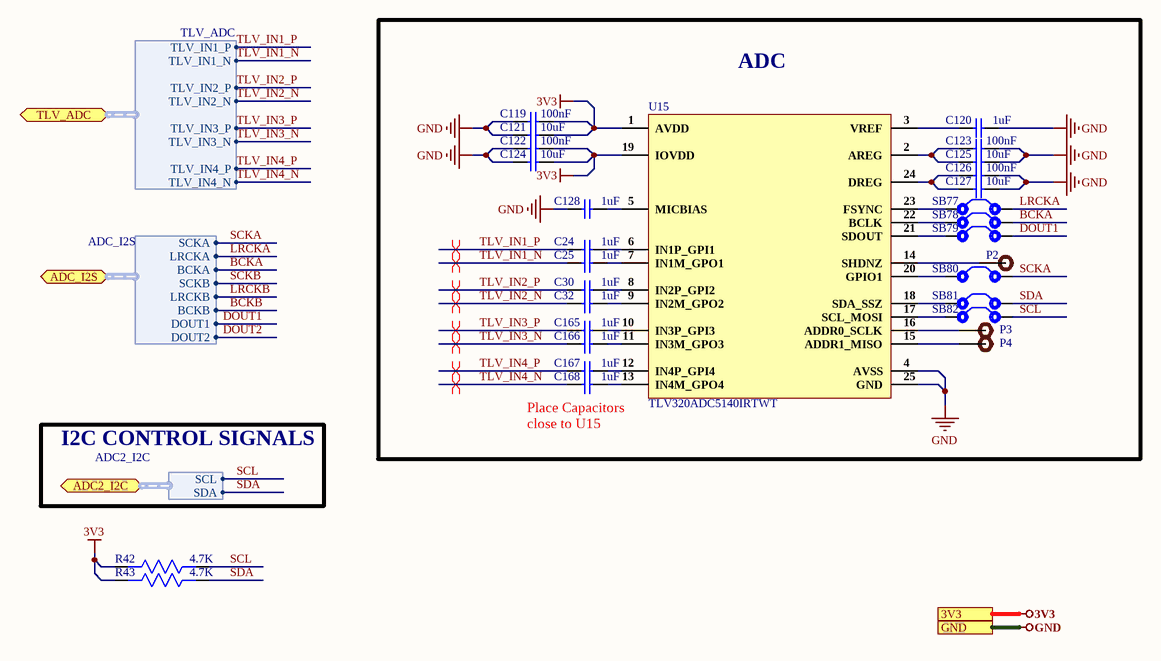
[diagram p6: ADC_3_Section.SchDoc]

### Parts
C24  1uF  [Cap-0402]
C25  1uF  [Cap-0402]
C30  1uF  [Cap-0402]
C32  1uF  [Cap-0402]
C119  100nF  [Cap-0402]
C120  1uF  [Cap-0402]
C121  10uF  [Cap-0603]
C122  100nF  [Cap-0402]
C123  100nF  [Cap-0402]
C124  10uF  [Cap-0603]
C125  10uF  [Cap-0603]
C126  100nF  [Cap-0402]
C127  10uF  [Cap-0603]
C128  1uF  [Cap-0402]
C165  1uF  [Cap-0402]
C166  1uF  [Cap-0402]
C167  1uF  [Cap-0402]
C168  1uF  [Cap-0402]
P2  TEST POINT  [Test-point]  (value not drawn)
P3  TEST POINT  [Test-point]  (value not drawn)
P4  TEST POINT  [Test-point]  (value not drawn)
R42  4.7K  [Res-0603]
R43  4.7K  [Res-0603]
SB77  Solder Bridge  [Solder Bridge]  (value not drawn)
SB78  Solder Bridge  [Solder Bridge]  (value not drawn)
SB79  Solder Bridge  [Solder Bridge]  (value not drawn)
SB80  Solder Bridge  [Solder Bridge]  (value not drawn)
SB81  Solder Bridge  [Solder Bridge]  (value not drawn)
SB82  Solder Bridge  [Solder Bridge]  (value not drawn)
U15  TLV320ADC5140IRTWT  [24-WQFN (4x4)]

### Blocks framed on the sheet
ADC: C24 C25 C30 C32 C119-C128 C165-C168 P2-P4 SB77-SB82 U15

### Ports
3V3, ADC2_I2C (bidir, harness ADC2_I2C), ADC_I2S (bidir, harness ADC_I2S), GND, TLV_ADC (bidir, harness TLV_ADC)

### Harnesses
ADC2_I2C: SCL, SDA
ADC_I2S: SCKA, LRCKA, BCKA, SCKB, LRCKB, BCKB, DOUT1, DOUT2
TLV_ADC: TLV_IN1_P, TLV_IN1_N, TLV_IN2_P, TLV_IN2_N, TLV_IN3_P, TLV_IN3_N, TLV_IN4_P, TLV_IN4_N

### Nets
3V3: C119.2 C121.2 C122.2 C124.2 R42.2 R43.2 U15.1(AVDD) U15.19(IOVDD) ; port 3V3
GND: C119.1 C120.2 C121.1 C122.1 C123.2 C124.1 C125.2 C126.2 C127.2 C128.1 U15.4(AVSS) U15.25(GND) ; port GND
BCKA: SB78.2 ; port ADC_I2S.BCKA  [project net ADC_I2S.BCKA]
DOUT1: SB79.2 ; port ADC_I2S.DOUT1  [project net ADC_I2S.DOUT1]
LRCKA: SB77.1 ; port ADC_I2S.LRCKA  [project net ADC_I2S.LRCKA]
SCKA: SB80.1 ; port ADC_I2S.SCKA  [project net ADC_I2S.SCKA]
SCL: R42.1 SB82.1 ; port ADC2_I2C.SCL
SDA: R43.1 SB81.1 ; port ADC2_I2C.SDA
TLV_IN1_N: C25.1 ; port TLV_ADC.TLV_IN1_N  [project net TLV_ADC.TLV_IN1_N]
TLV_IN1_P: C24.1 ; port TLV_ADC.TLV_IN1_P  [project net TLV_ADC.TLV_IN1_P]
TLV_IN2_N: C32.1 ; port TLV_ADC.TLV_IN2_N  [project net TLV_ADC.TLV_IN2_N]
TLV_IN2_P: C30.1 ; port TLV_ADC.TLV_IN2_P  [project net TLV_ADC.TLV_IN2_P]
TLV_IN3_N: C166.1 ; port TLV_ADC.TLV_IN3_N  [project net TLV_ADC.TLV_IN3_N]
TLV_IN3_P: C165.1 ; port TLV_ADC.TLV_IN3_P  [project net TLV_ADC.TLV_IN3_P]
TLV_IN4_N: C168.1 ; port TLV_ADC.TLV_IN4_N  [project net TLV_ADC.TLV_IN4_N]
TLV_IN4_P: C167.1 ; port TLV_ADC.TLV_IN4_P  [project net TLV_ADC.TLV_IN4_P]
NetC24_2: C24.2 U15.6(IN1P_GPI1)
NetC25_2: C25.2 U15.7(IN1M_GPO1)
NetC30_2: C30.2 U15.8(IN2P_GPI2)
NetC32_2: C32.2 U15.9(IN2M_GPO2)
NetC120_1: C120.1 U15.3(VREF)
NetC123_1: C123.1 C125.1 U15.2(AREG)
NetC126_1: C126.1 C127.1 U15.24(DREG)
NetC128_2: C128.2 U15.5(MICBIAS)
NetC165_2: C165.2 U15.10(IN3P_GPI3)
NetC166_2: C166.2 U15.11(IN3M_GPO3)
NetC167_2: C167.2 U15.12(IN4P_GPI4)
NetC168_2: C168.2 U15.13(IN4M_GPO4)
NetP2_1: P2.1 U15.14(SHDNZ)
NetP3_1: P3.1 U15.16(ADDR0_SCLK)
NetP4_1: P4.1 U15.15(ADDR1_MISO)
NetSB77_2: SB77.2 U15.23(FSYNC)
NetSB78_1: SB78.1 U15.22(BCLK)
NetSB79_1: SB79.1 U15.21(SDOUT)
NetSB80_2: SB80.2 U15.20(GPIO1)
NetSB81_2: SB81.2 U15.18(SDA_SSZ)
NetSB82_2: SB82.2 U15.17(SCL_MOSI)

### Layout directives
differential pair; differential pair class OUT1_Lines; net class OUT1: TLV_ADC.TLV_IN1_N, TLV_ADC.TLV_IN1_P, TLV_ADC.TLV_IN2_N, TLV_ADC.TLV_IN2_P, TLV_ADC.TLV_IN3_N, TLV_ADC.TLV_IN3_P, TLV_ADC.TLV_IN4_N, TLV_ADC.TLV_IN4_P

### Notes on the sheet
- I2C CONTROL SIGNALS
- Place Capacitors close to U15
- File:
- Title:
- Date:
- Page
- Num:
- Total:
- Drawn By: Huzaifa Ali

### Library data of the parts
C24 C25 C30 C32 C120 C128 C165-C168 = CC0402KRX5R8BB105: as C53 on sheet ADC_2_Section; Supplier 1: Mouser; Manufacturer Part Number: CC0402KRX5R8BB105; RoHS: Yes; Category: Ceramic Capacitors; Stock 1: 91975; Pricing 1: 1=0.30000, 10=0.20400, 50=0.20400, 100=0.11600, 1000=0.07200, 10000=0.05900 (USD); Mount: Surface Mount; Case/Package: 0402; Case Code (Metric): 1005; Case Code (Imperial): 0402; Weight: 2.3E-05oz; Min Operating Temperature: -55°C; Max Operating Temperature: 85°C; Packaging: Tape and Reel; Capacitance: 1uF; Voltage Rating: 25V; Dielectric: X5R; Termination: SMD/SMT; Voltage Rating (DC): 25V; Package Quantity: 10000; Length: 0.039inch; Width: 0.02inch; Thickness: 0.022inch; Lead Free: Lead Free; Halogen Free: Halogen Free; RoHS Compliant: Yes; ComponentLink1URL: http://www.mouser.com/ds/2/447/Yageo_UPY-GP_NP0_16V-to-50V_9-358835.pdf?src-supplier=Mouser; ComponentLink1Description: http://www.mouser.com/ds/2/447/Yageo_UPY-GP_NP0_16V-to-50V_9-358835.pdf?src-supplier=Mouser; ComponentLink2URL: http://www.yageo.com/documents/recent/UPY-GPHC_X5R_4V-to-50V_25.pdf?src-supplier=Digi-Key; ComponentLink2Description: http://www.yageo.com/documents/recent/UPY-GPHC_X5R_4V-to-50V_25.pdf?src-supplier=Digi-Key; ComponentLink3URL: https://4donline.ihs.com/images/VipMasterIC/IC/YAGO/YAGO-S-A0006851646/YAGO-S-A0006851646-1.pdf?hkey=6D3A4C79FDBF58556ACFDE234799DDF0&src-supplier=Newark; ComponentLink3Description: https://4donline.ihs.com/images/VipMasterIC/IC/YAGO/YAGO-S-A0006851646/YAGO-S-A0006851646-1.pdf?hkey=6D3A4C79FDBF58556ACFDE234799DDF0&src-supplier=Newark; Supplier Part Number 1: 603-CC402KRX5R8BB105; LCSC Part Number: C326568
C119 C122 C123 C126 = CC0402KRX5R7BB104: as C141 on sheet ADC_2_Section; Supplier 1: Mouser; Manufacturer Part Number: CC0402KRX5R7BB104; RoHS: Yes; Category: Ceramic Capacitors; Stock 1: 936792; Pricing 1: 1=0.10000, 10=0.02300, 50=0.02300, 100=0.01100, 1000=0.00600, 10000=0.00400 (USD); Mount: Surface Mount; Case/Package: 0402; Number of Pins: 2; Case Code (Metric): 1005; Case Code (Imperial): 0402; Min Operating Temperature: -55°C; Max Operating Temperature: 85°C; Capacitance: 100nF; Dielectric: X5R; Packaging: Tape and Reel; Voltage Rating: 16V; Package Quantity: 1; Voltage Rating (DC): 16V; Termination: SMD/SMT; Resistor Type: Ceramic; Series: CC; Construction: Flat; Length: 1mm; Width: 0.02inch; Height: 0.5mm; Thickness: 0.022inch; Depth: 0.5mm; Radiation Hardening: No; REACH SVHC: Unknown; Lead Free: Lead Free; Halogen Free: Halogen Free; RoHS Compliant: Yes; ComponentLink1URL: https://datasheet.ciiva.com/155/mlccorderingcode-155879.pdf?src-supplier=Digi-Key; ComponentLink1Description: https://datasheet.ciiva.com/155/mlccorderingcode-155879.pdf?src-supplier=Digi-Key; ComponentLink2URL: https://datasheet.ciiva.com/155/mlccorderingcode-155878.pdf?src-supplier=Digi-Key; ComponentLink2Description: https://datasheet.ciiva.com/155/mlccorderingcode-155878.pdf?src-supplier=Digi-Key; ComponentLink3URL: https://datasheet.ciiva.com/155/mlccorderingcode-155880.pdf?src-supplier=Digi-Key; ComponentLink3Description: https://datasheet.ciiva.com/155/mlccorderingcode-155880.pdf?src-supplier=Digi-Key; ComponentLink4URL: https://datasheet.ciiva.com/11464/upy-gphc-x5r-4v-to-50v-12-11464869.pdf?src-supplier=Avnet; ComponentLink4Description: https://datasheet.ciiva.com/11464/upy-gphc-x5r-4v-to-50v-12-11464869.pdf?src-supplier=Avnet; Supplier Part Number 1: 603-CC402KRX5R7BB104; LCSC Part Number: C106204
C121 C124 C125 C127 = C1608X5R1E106M080AC: as C56 on sheet ADC_2_Section; Supplier 1: Digi-Key; Manufacturer Part Number: C1608X5R1E106M080AC; Stock 1: 61681; Pricing 1: 1=0.96, 10=0.704, 100=0.483, 500=0.38238, 1000=0.322 (USD); Mount: Surface Mount; Case/Package: 0603; Weight: 7.1E-05oz; Case Code (Imperial): 0603; Case Code (Metric): 1608; Min Operating Temperature: -55°C; Max Operating Temperature: 85°C; Capacitance: 10uF; Packaging: Tape and Reel; Voltage Rating: 25V; Voltage Rating (DC): 25V; Termination: SMD/SMT; Package Quantity: 1; Dielectric: X5R; Composition: Ceramic; Length: 1.6mm; Height: 0.8mm; Width: 0.8mm; Thickness: 0.039inch; Depth: 0.8mm; Lead Free: Lead Free; REACH SVHC: No SVHC; Supplier Part Number 1: 445-9015-1-ND; LCSC Part Number: C2168289
P2-P4 = TEST POINT: Test Point ON
R42 R43 = RC0603JR-074K7L: RES SMD 4.7K OHM 5% 1/10W 0603; Manufacturer: Yageo; Resistance: 4.7kR; Temperature Coefficient: 100ppm/°C; Voltage Rating (DC): 50V; Power Rating: 100mW; Supplier 1: Digi-Key; Manufacturer Part Number: RC0603JR-074K7L; Stock 1: 19706643; Pricing 1: 1=0.1, 10=0.02, 100=0.0081, 1000=0.00362, 2500=0.00314 (USD); Case/Package: 0603; Number of Pins: 2; Case Code (Imperial): 0603; Case Code (Metric): 1608; Min Operating Temperature: -55°C; Max Operating Temperature: 155°C; Tolerance: 5%; Composition: Thick Film; Packaging: Tape and Reel; Voltage Rating: 50V; Termination: SMD/SMT; Military Standard: Not; Length: 1.6mm; Width: 0.8mm; Depth: 0.8mm; REACH SVHC: No SVHC; Lead Free: Lead Free; ComponentLink1URL: http://www.farnell.com/datasheets/443971.pdf?src-supplier=Element14; ComponentLink1Description: http://www.farnell.com/datasheets/443971.pdf?src-supplier=Element14; Supplier Part Number 1: 311-4.7KGRCT-ND; LCSC Part Number: C105428
SB77-SB82 = Solder Bridge: Solder Bridge ON
U15 = TLV320ADC5140IRTWT: IC ADC AUDIO 768K 24WQFN; Manufacturer: Texas Instruments; Supplier 1: Digi-Key; Manufacturer Part Number: TLV320ADC5140IRTWT; RoHS: Yes; Stock 1: 40; Pricing 1: 1=6.07000, 10=5.44900, 25=5.15160, 100=4.46470 (USD); RoHS Compliant: Yes; ComponentLink1URL: http://www.ti.com/general/docs/suppproductinfo.tsp?distId=10&amp;gotoUrl=http%3A%2F%2Fwww.ti.com%2Flit%2Fgpn%2Ftlv320adc5140&src-supplier=Digi-Key; ComponentLink1Description: http://www.ti.com/general/docs/suppproductinfo.tsp?distId=10&amp;gotoUrl=http%3A%2F%2Fwww.ti.com%2Flit%2Fgpn%2Ftlv320adc5140&src-supplier=Digi-Key; Supplier Part Number 1: 296-TLV320ADC5140IRTWTCT-ND; LCSC Part Number: C1852018; Item Type: IC